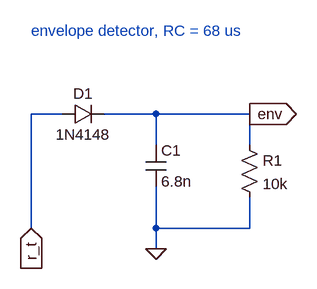
[diagram p0: schematic Envelope_Detector.asc]
Envelope_Detector.asc, the LTspice schematic file:
Version 4.1
SHEET 1 880 680
WIRE 112 32 64 32
WIRE 256 32 176 32
WIRE 400 32 256 32
WIRE 256 80 256 32
WIRE 400 80 400 32
WIRE 64 208 64 32
WIRE 256 208 256 144
WIRE 400 208 400 160
WIRE 400 208 256 208
WIRE 256 240 256 208
FLAG 400 32 env
IOPIN 400 32 Out
FLAG 64 208 r_t
IOPIN 64 208 In
FLAG 256 240 0
SYMBOL diode 112 48 R270
WINDOW 0 32 32 VTop 2
WINDOW 3 0 32 VBottom 2
SYMATTR InstName D1
SYMATTR Value 1N4148
SYMBOL cap 240 80 R0
SYMATTR InstName C1
SYMATTR Value 6.8n
SYMBOL res 384 64 R0
SYMATTR InstName R1
SYMATTR Value 10k
TEXT 64 -96 Left 2 ;envelope detector, RC = 68 us

The netlist it stands for:
* Envelope_Detector.asc
D1 r_t env 1N4148
C1 env 0 6.8n
R1 env 0 10k
.model D D
.lib standard.dio
* envelope detector, RC = 68 us
.backanno
.end